# Altium schematic sheet FPGA_Core.SchDoc
size A4; SheetNumber: 5; SheetTotal: 5
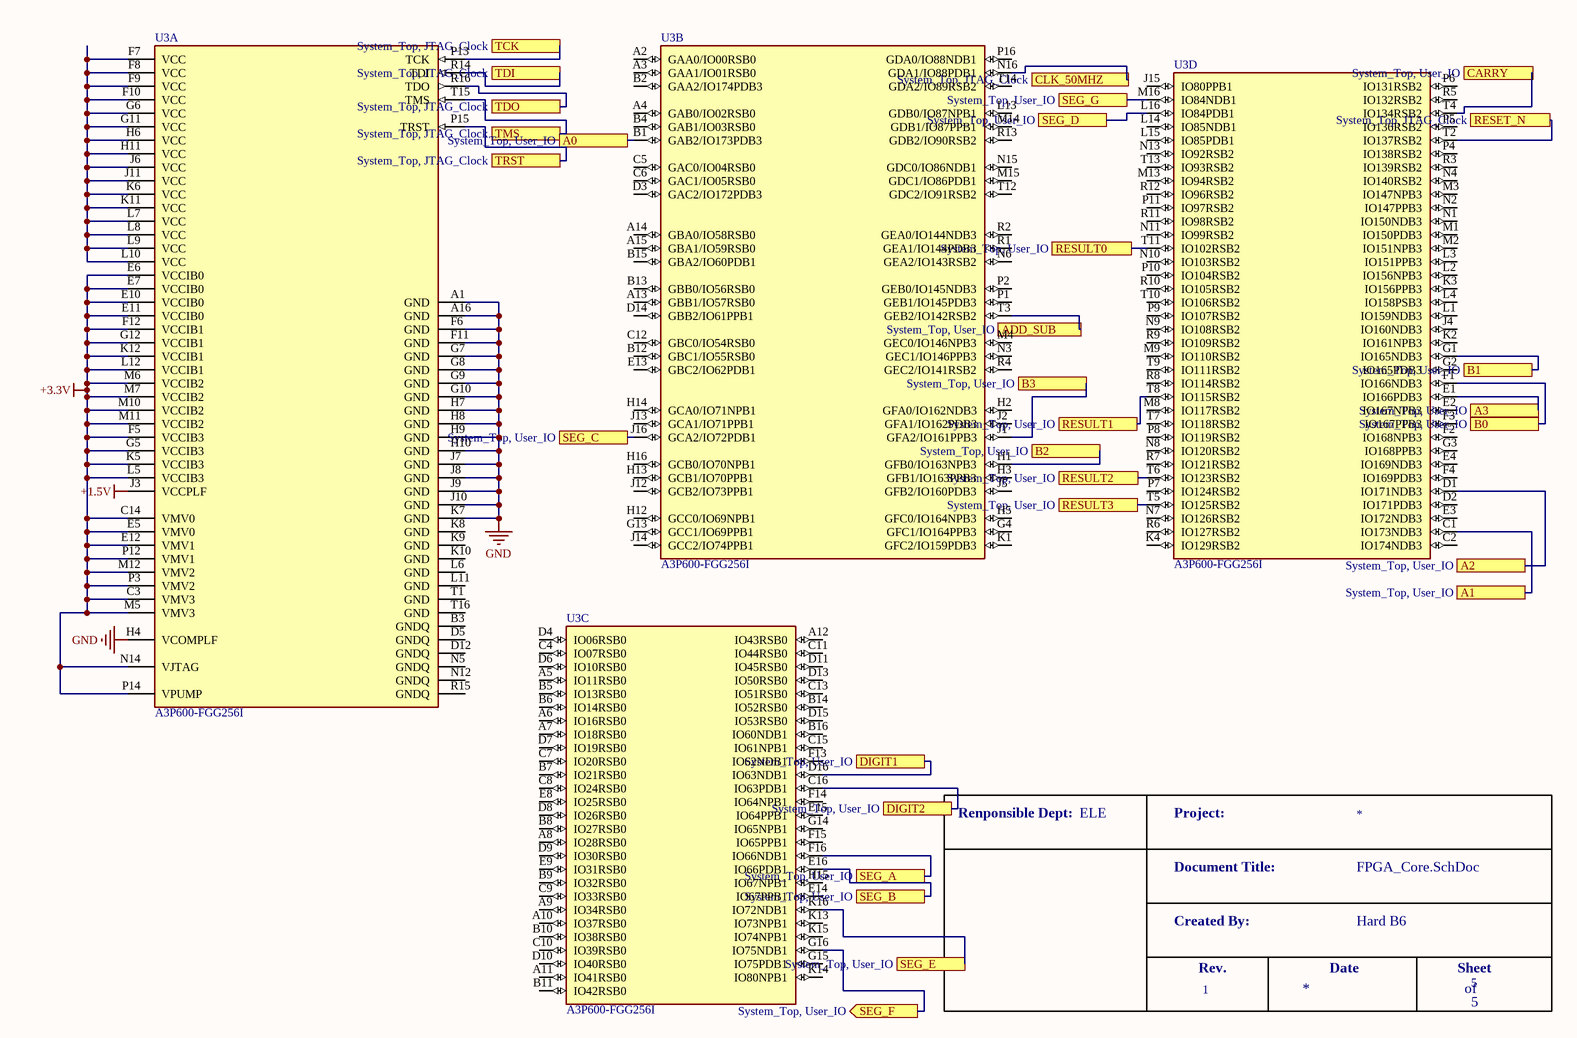
[diagram p0: FPGA_Core.SchDoc]

## Parts
*  HSHL Title Block  (value not drawn)  (graphical)
U3  A3P600-FGG256I  [FP-FG256-IPC_C]  (parts A,B,C,D of 4)

## Ports
A0 (see System_Top, User_IO), A1 (see System_Top, User_IO), A2 (see System_Top, User_IO), A3 (see System_Top, User_IO), ADD_SUB (see System_Top, User_IO), B0 (see System_Top, User_IO), B1 (see System_Top, User_IO), B2 (see System_Top, User_IO), B3 (see System_Top, User_IO), CARRY (see System_Top, User_IO), CLK_50MHZ (see System_Top, JTAG_Clock), DIGIT1 (see System_Top, User_IO), DIGIT2 (see System_Top, User_IO), RESET_N (see System_Top, JTAG_Clock), RESULT0 (see System_Top, User_IO), RESULT1 (see System_Top, User_IO), RESULT2 (see System_Top, User_IO), RESULT3 (see System_Top, User_IO), SEG_A (see System_Top, User_IO), SEG_B (see System_Top, User_IO), SEG_C (see System_Top, User_IO), SEG_D (see System_Top, User_IO), SEG_E (see System_Top, User_IO), SEG_F (out, see System_Top, User_IO), SEG_G (see System_Top, User_IO), TCK (see System_Top, JTAG_Clock), TDI (see System_Top, JTAG_Clock), TDO (see System_Top, JTAG_Clock), TMS (see System_Top, JTAG_Clock), TRST (see System_Top, JTAG_Clock)

## Nets
+1.5V: U3.J3(VCCPLF)
+3.3V: U3.C3(VMV3) U3.C14(VMV0) U3.E5(VMV0) U3.E6(VCCIB0) U3.E7(VCCIB0) U3.E10(VCCIB0) U3.E11(VCCIB0) U3.E12(VMV1) U3.F5(VCCIB3) U3.F12(VCCIB1) U3.G5(VCCIB3) U3.G12(VCCIB1) U3.K5(VCCIB3) U3.K12(VCCIB1) U3.L5(VCCIB3) U3.L12(VCCIB1) U3.M5(VMV3) U3.M6(VCCIB2) U3.M7(VCCIB2) U3.M10(VCCIB2) U3.M11(VCCIB2) U3.M12(VMV2) U3.N14(VJTAG) U3.P3(VMV2) U3.P12(VMV1) U3.P14(VPUMP)
GND: U3.A1(GND) U3.A16(GND) U3.F6(GND) U3.F11(GND) U3.G7(GND) U3.G8(GND) U3.G9(GND) U3.G10(GND) U3.H4(VCOMPLF) U3.H7(GND) U3.H8(GND) U3.H9(GND) U3.H10(GND) U3.J7(GND) U3.J8(GND) U3.J9(GND) U3.J10(GND) U3.K7(GND)
A0: U3.B1(GAB2/IO173PDB3) ; port A0
A1: U3.C1(IO173NDB3) ; port A1
A2: U3.D1(IO171NDB3) ; port A2
A3: U3.E1(IO166PDB3) ; port A3
ADD_SUB: U3.T3(GEB2/IO142RSB2) ; port ADD_SUB
B0: U3.F1(IO166NDB3) ; port B0
B1: U3.G1(IO165NDB3) ; port B1
B2: U3.H1(GFB0/IO163NPB3) ; port B2
B3: U3.J1(GFA2/IO161PPB3) ; port B3
CARRY: U3.T4(IO134RSB2) ; port CARRY
CLK_50MHZ: U3.N16(GDA1/IO88PDB1) ; port CLK_50MHZ
DIGIT1: U3.D16(IO63NDB1) ; port DIGIT1
DIGIT2: U3.C16(IO63PDB1) ; port DIGIT2
RESET_N: U3.T2(IO137RSB2) ; port RESET_N
RESULT0: U3.T11(IO102RSB2) ; port RESULT0
RESULT1: U3.T8(IO115RSB2) ; port RESULT1
RESULT2: U3.T6(IO123RSB2) ; port RESULT2
RESULT3: U3.T5(IO125RSB2) ; port RESULT3
SEG_A: U3.F16(IO66NDB1) ; port SEG_A
SEG_B: U3.E16(IO66PDB1) ; port SEG_B
SEG_C: U3.J16(GCA2/IO72PDB1) ; port SEG_C
SEG_D: U3.L16(IO84PDB1) ; port SEG_D
SEG_E: U3.K16(IO72NDB1) ; port SEG_E
SEG_F: U3.G16(IO75NDB1) ; port SEG_F
SEG_G: U3.M16(IO84NDB1) ; port SEG_G
TCK: U3.P13(TCK) ; port TCK
TDI: U3.R14(TDI) ; port TDI
TDO: U3.R16(TDO) ; port TDO
TMS: U3.T15(TMS) ; port TMS
TRST: U3.P15(TRST) ; port TRST
NetU3_F7: U3.F7(VCC) U3.F8(VCC) U3.F9(VCC) U3.F10(VCC) U3.G6(VCC) U3.G11(VCC) U3.H6(VCC) U3.H11(VCC) U3.J6(VCC) U3.J11(VCC) U3.K6(VCC) U3.K11(VCC) U3.L7(VCC) U3.L8(VCC) U3.L9(VCC) U3.L10(VCC)

Not connected (* = marked no-connect by the designer): U3 A2(GAA0/IO00RSB0) A3(GAA1/IO01RSB0) A4(GAB0/IO02RSB0) A5(IO11RSB0) A6(IO16RSB0) A7(IO18RSB0) A8(IO28RSB0) A9(IO34RSB0) A10(IO37RSB0) A11(IO41RSB0) A12(IO43RSB0) A13(GBB1/IO57RSB0) A14(GBA0/IO58RSB0) A15(GBA1/IO59RSB0) B2(GAA2/IO174PDB3) B3(GNDQ) B4(GAB1/IO03RSB0) B5(IO13RSB0) B6(IO14RSB0) B7(IO21RSB0) B8(IO27RSB0) B9(IO32RSB0) B10(IO38RSB0) B11(IO42RSB0) B12(GBC1/IO55RSB0) B13(GBB0/IO56RSB0) B14(IO52RSB0) B15(GBA2/IO60PDB1) B16(IO60NDB1) C2(IO174NDB3) C4(IO07RSB0) C5(GAC0/IO04RSB0) C6(GAC1/IO05RSB0) C7(IO20RSB0) C8(IO24RSB0) C9(IO33RSB0) C10(IO39RSB0) C11(IO44RSB0) C12(GBC0/IO54RSB0) C13(IO51RSB0) C15(IO61NPB1) D2(IO171PDB3) D3(GAC2/IO172PDB3) D4(IO06RSB0) D5(GNDQ) D6(IO10RSB0) D7(IO19RSB0) D8(IO26RSB0) D9(IO30RSB0) D10(IO40RSB0) D11(IO45RSB0) D12(GNDQ) D13(IO50RSB0) D14(GBB2/IO61PPB1) D15(IO53RSB0) E2(IO167NPB3) E3(IO172NDB3) E4(IO169NDB3) E8(IO25RSB0) E9(IO31RSB0) E13(GBC2/IO62PDB1) E14(IO67PPB1) E15(IO64PPB1) F2(IO168NPB3) F3(IO167PPB3) F4(IO169PDB3) F13(IO62NDB1) F14(IO64NPB1) F15(IO65PPB1) G2(IO165PDB3) G3(IO168PPB3) G4(GFC1/IO164PPB3) G13(GCC1/IO69PPB1) G14(IO65NPB1) G15(IO75PDB1) H2(GFA0/IO162NDB3) H3(GFB1/IO163PPB3) H5(GFC0/IO164NPB3) H12(GCC0/IO69NPB1) H13(GCB1/IO70PPB1) H14(GCA0/IO71NPB1) H15(IO67NPB1) H16(GCB0/IO70NPB1) J2(GFA1/IO162PDB3) J4(IO160NDB3) J5(GFB2/IO160PDB3) J12(GCB2/IO73PPB1) J13(GCA1/IO71PPB1) J14(GCC2/IO74PPB1) J15(IO80PPB1) K1(GFC2/IO159PDB3) K2(IO161NPB3) K3(IO156PPB3) K4(IO129RSB2) K8(GND) K9(GND) K10(GND) K13(IO73NPB1) K14(IO80NPB1) K15(IO74NPB1) L1(IO159NDB3) L2(IO156NPB3) L3(IO151PPB3) L4(IO158PSB3) L6(GND) L11(GND) L13(GDB0/IO87NPB1) L14(IO85NDB1) L15(IO85PDB1) M1(IO150PDB3) M2(IO151NPB3) M3(IO147NPB3) M4(GEC0/IO146NPB3) M8(IO117RSB2) M9(IO110RSB2) M13(IO94RSB2) M14(GDB1/IO87PPB1) M15(GDC1/IO86PDB1) N1(IO150NDB3) N2(IO147PPB3) N3(GEC1/IO146PPB3) N4(IO140RSB2) N5(GNDQ) N6(GEA2/IO143RSB2) N7(IO126RSB2) N8(IO120RSB2) N9(IO108RSB2) N10(IO103RSB2) N11(IO99RSB2) N12(GNDQ) N13(IO92RSB2) N15(GDC0/IO86NDB1) P1(GEB1/IO145PDB3) P2(GEB0/IO145NDB3) P4(IO138RSB2) P5(IO136RSB2) P6(IO131RSB2) P7(IO124RSB2) P8(IO119RSB2) P9(IO107RSB2) P10(IO104RSB2) P11(IO97RSB2) P16(GDA0/IO88NDB1) R1(GEA1/IO144PDB3) R2(GEA0/IO144NDB3) R3(IO139RSB2) R4(GEC2/IO141RSB2) R5(IO132RSB2) R6(IO127RSB2) R7(IO121RSB2) R8(IO114RSB2) R9(IO109RSB2) R10(IO105RSB2) R11(IO98RSB2) R12(IO96RSB2) R13(GDB2/IO90RSB2) R15(GNDQ) T1(GND) T7(IO118RSB2) T9(IO111RSB2) T10(IO106RSB2) T12(GDC2/IO91RSB2) T13(IO93RSB2) T14(GDA2/IO89RSB2) T16(GND)

## Notes on the sheet
- DWG. NO.
- REV.
- SHT.
- THIS DOCUMENT AND THE DATA DISCLOSED HEREIN OR HEREWITH IS THE PROPERTY OF ALTIUM LIMITED AND MAY BE FREELY DISTRIBUTED IN WHOLE. NO RIGHTS ARE RESERVED OR EXPRESS OR IMPLIED WARANTEE GIVEN.
- REVISION
- DESCRIPTION
- DATE
- APPROVED
- ENG:
- APPROVALS
- PROJECT
- DSN:
- CHK:
- REFERENCE DOCUMENTS
- PROJECT REVISION:
- TITLE
- DOCUMENT REVISION:
- DESIGN ITEM:
- BOM:
- FAB DWG:
- PCB DWG:
- ASSY DWG:
- SCALE:
- SIZE
- B
- CAGE CODE
- FILE NAME
- DWG NO.
- SHEET
- OF
- REV
- (in symbol HSHL Title Block) Renponsible Dept:; ELE; Project:; Document Title:; Created By:; Hard B6; Rev.; Date; Sheet; 1; of

## Library data of the parts
U3 = CMP-031-00006-1: FPGA ProASIC®3 Family 600K Gates 231MHz 130nm (CMOS) Technology 1.5V 256-Pin FBGA; Min Supply Voltage: 1.4V; Max Supply Voltage: 3.6V; Pins: 256; Max Operating Temperature: 100°C; Mounting Technology: Surface Mount; Min Operating Temperature: -40°C